# Altium schematic sheet variants.SchDoc
size A4; SheetNumber: 1; SheetTotal: 1
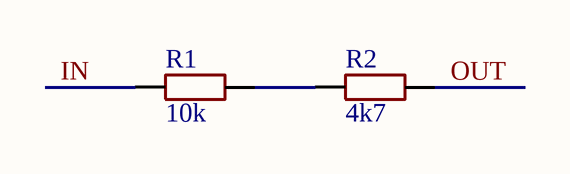
[diagram p0: variants.SchDoc]

## Parts
R1  10k  [R0603-TEST]
R2  4k7  [R0603-TEST]

## Nets
IN: R1.1
OUT: R2.2
NetR1_2: R1.2 R2.1

## Library data of the parts
R1 R2 = RES-TEST: Resistor, test symbol